# Altium schematic sheet 06_I2C_OLED.SchDoc
size A4
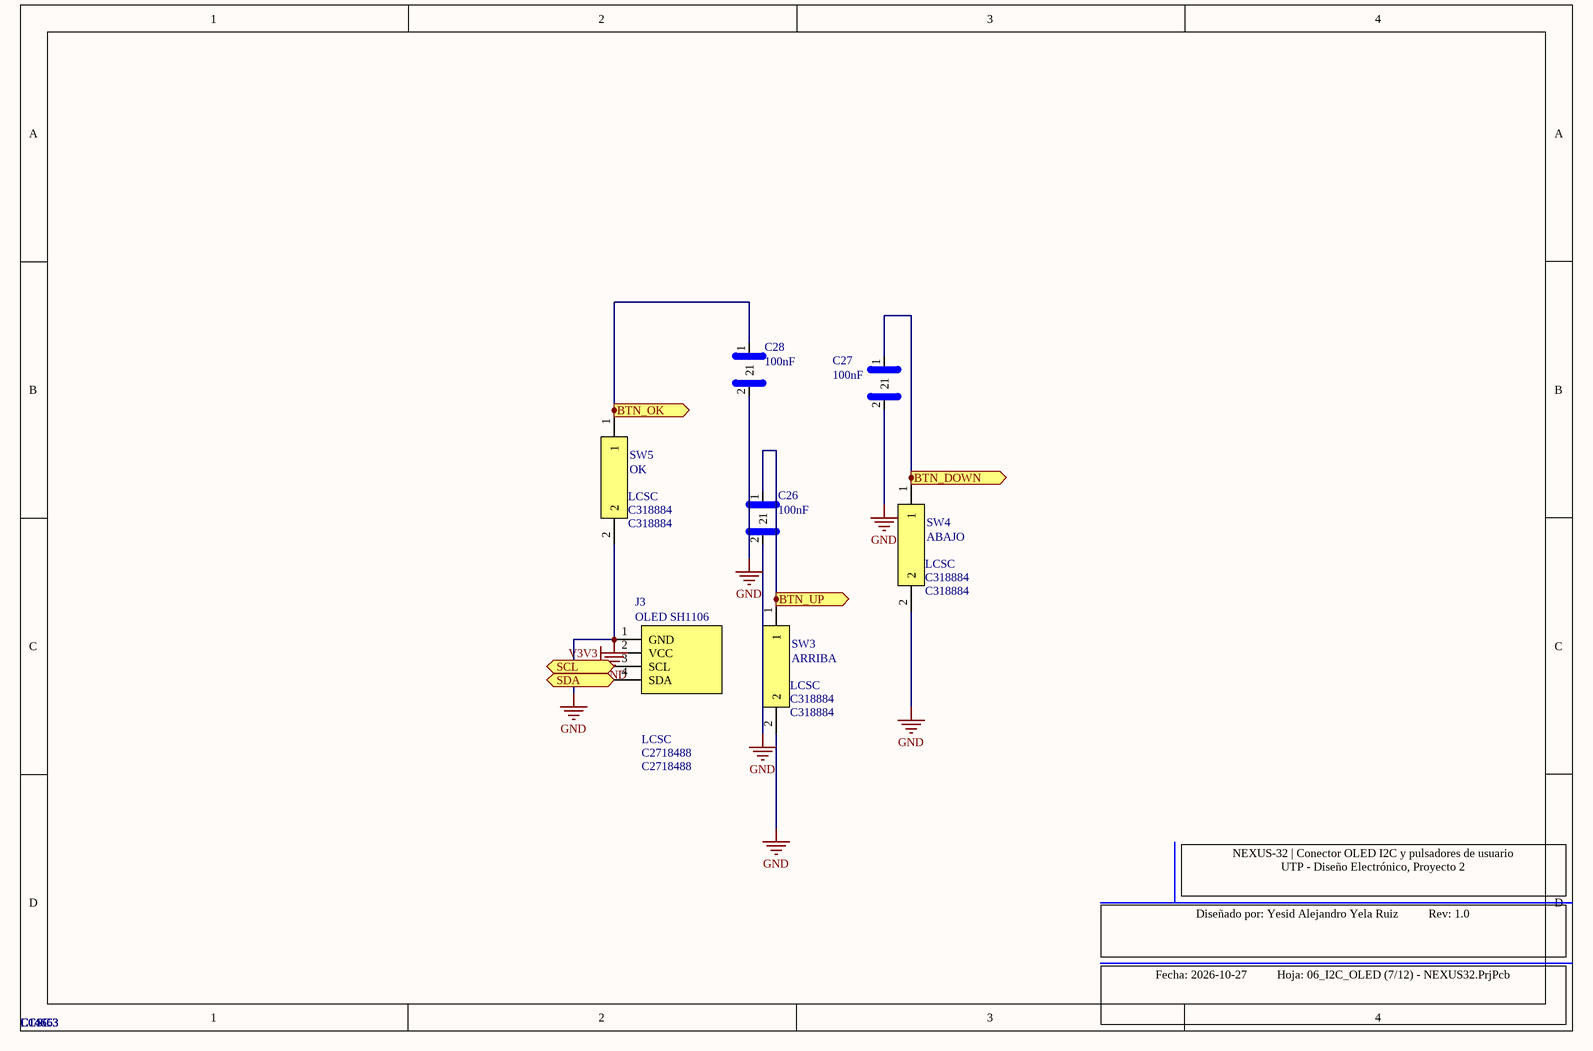
[diagram p0: 06_I2C_OLED.SchDoc]

## Parts
C26  100nF  Supplier 1: LCSC  Supplier Part Number 1: C14663  [R_0603]
C27  100nF  Supplier 1: LCSC  Supplier Part Number 1: C14663  [R_0603]
C28  100nF  Supplier 1: LCSC  Supplier Part Number 1: C14663  [R_0603]
J3  OLED SH1106  Supplier 1: LCSC  Supplier Part Number 1: C2718488  [HDR_1x4_P2.54_F]
SW3  ARRIBA  Supplier 1: LCSC  Supplier Part Number 1: C318884  [SW_TS-1187A]
SW4  ABAJO  Supplier 1: LCSC  Supplier Part Number 1: C318884  [SW_TS-1187A]
SW5  OK  Supplier 1: LCSC  Supplier Part Number 1: C318884  [SW_TS-1187A]

## Ports
BTN_DOWN (out), BTN_OK (out), BTN_UP (out), SCL (bidir), SDA (bidir)

## Nets
GND: C26.2 C27.2 C28.2 J3.1(GND) SW3.2 SW4.2 SW5.2
V3V3: J3.2(VCC)
BTN_DOWN: C27.1 SW4.1 ; port BTN_DOWN
BTN_OK: C28.1 SW5.1 ; port BTN_OK
BTN_UP: C26.1 SW3.1 ; port BTN_UP
SCL: J3.3(SCL) ; port SCL
SDA: J3.4(SDA) ; port SDA

## Notes on the sheet
- NEXUS-32 | Conector OLED I2C y pulsadores de usuario
  UTP - Diseño Electrónico, Proyecto 2
- Diseñado por: Yesid Alejandro Yela Ruiz          Rev: 1.0
- Fecha: 2026-10-27          Hoja: 06_I2C_OLED (7/12) - NEXUS32.PrjPcb

## Library data of the parts
C26-C28 = CAP_0603: Condensador ceramico SMD 0603; Manufacturer: YAGEO; Manufacturer Part Number: CC0603KRX7R9BB104; Datasheet: https://wmsc.lcsc.com/wmsc/upload/file/pdf/v2/lcsc/2206010045_UNI-ROYAL-Uniroyal-Elec-0603WAF1002T5E_C25804.pdf; LCSC Part #: C14663
J3 = HDR_1x4_2.54_F: Cabezal hembra 1x4 paso 2.54mm para modulo OLED I2C (Boomele 2.54-1*4PFemale); orden GND-VCC-SCL-SDA (a confirmar con el modulo real); Manufacturer: Boomele; Manufacturer Part Number: 2.54-1*4PFemale; LCSC Part #: C2718488; Datasheet: https://wmsc.lcsc.com/wmsc/upload/file/pdf/v2/lcsc/2412111658_BOOMELE-Boom-Precision-Elec-2-54-1-4P_C2718488.pdf
SW3-SW5 = TS-1187A-B-A-B: Pulsador tactil SMD 5.1x5.1 (XKB TS-1187A-B-A-B); pads A-B unidos (1) y C-D unidos (2); Manufacturer: XKB Connection; Manufacturer Part Number: TS-1187A-B-A-B; LCSC Part #: C318884; Datasheet: https://wmsc.lcsc.com/wmsc/upload/file/pdf/v2/lcsc/2304140030_XKB-Connection-TS-1187A-B-A-B_C318884.pdf